# Altium schematic sheet nRF_Part.SchDoc
size 381 x 241 mm; SheetNumber: 1; SheetTotal: 17
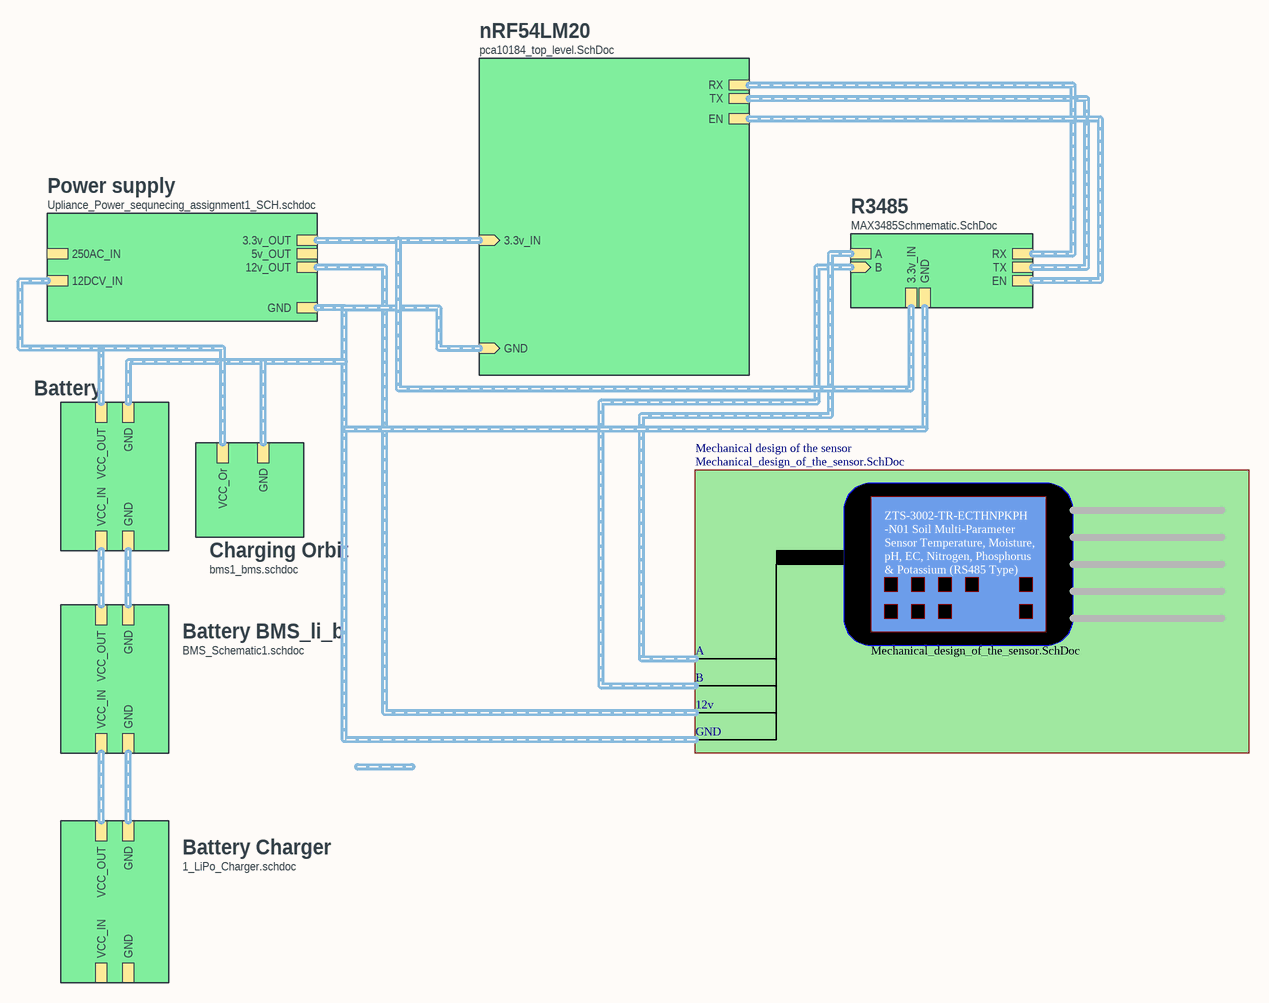
[diagram p0: nRF_Part.SchDoc]

## Sub-sheets
Battery = ?: VCC_IN (harness TWI), GND (harness TWI), VCC_OUT (harness USB_CC), GND (harness USB_CC)
Battery BMS_li_b = BMS_Schematic1.schdoc: VCC_IN (harness TWI), GND (harness TWI), VCC_OUT (harness USB_CC), GND (harness USB_CC)
Battery Charger = 1_LiPo_Charger.schdoc: GND (harness TWI), VCC_IN (harness TWI), VCC_OUT (harness USB_CC), GND (harness USB_CC)
Charging Orbit = bms1_bms.schdoc: GND (harness USB_CC), VCC_Or (harness USB_CC)
Mechanical design of the sensor = Mechanical_design_of_the_sensor.SchDoc: no entries
nRF54LM20 = pca10184_top_level.SchDoc: RX (harness SWD), TX (harness TRACE), GND (in), EN (harness GPIO_P0), 3.3v_IN (in)
Power supply = Upliance_Power_sequnecing_assignment1_SCH.schdoc: 12DCV_IN (harness TWI), 3.3v_OUT (harness USB_CC), GND (harness USB_CC), 5v_OUT (harness USB_CC), 12v_OUT (harness USB_CC), 250AC_IN (harness TWI)
R3485 = MAX3485Schmematic.SchDoc: A (harness GPIO_P2), RX (harness GPIO_P2), TX (harness QSPI), B (in), EN (harness GPIO_P2), 3.3v_IN (harness GPIO_P2), GND (harness GPIO_P2)

## Buses and harness runs
harness sheet Battery BMS_li_b/GND = sheet Battery Charger/GND
harness sheet Battery BMS_li_b/GND = sheet Battery/GND
harness sheet Battery BMS_li_b/VCC_IN = sheet Battery Charger/VCC_OUT
harness sheet Battery BMS_li_b/VCC_OUT = sheet Battery/VCC_IN
harness sheet Battery/GND = sheet Charging Orbit/GND = sheet nRF54LM20/GND = sheet Power supply/GND = sheet R3485/GND
harness sheet Battery/VCC_OUT = sheet Charging Orbit/VCC_Or = sheet Power supply/12DCV_IN
harness sheet nRF54LM20/3.3v_IN = sheet Power supply/3.3v_OUT = sheet R3485/3.3v_IN
harness sheet nRF54LM20/EN = sheet R3485/EN
harness sheet nRF54LM20/RX = sheet R3485/RX
harness sheet nRF54LM20/TX = sheet R3485/TX

## Notes on the sheet
- ZTS-3002-TR-ECTHNPKPH
- -N01 Soil Multi-Parameter
- Sensor Temperature, Moisture,
- pH, EC, Nitrogen, Phosphorus
- & Potassium (RS485 Type)
- A
- Mechanical_design_of_the_sensor.SchDoc
- B
- 12v
- GND